# EasyEDA Pro project pcbnrf.eprj

# Schematic Schematic1
Board Name: Board1; Create Date: 2026-09-04; Page Name: P1; Project Name: projetderechercehamine; Schematic Name: Schematic1; Update Date: 2026-09-11; Company: EasyEDA.com; Page Size: A4; Version: V1.0
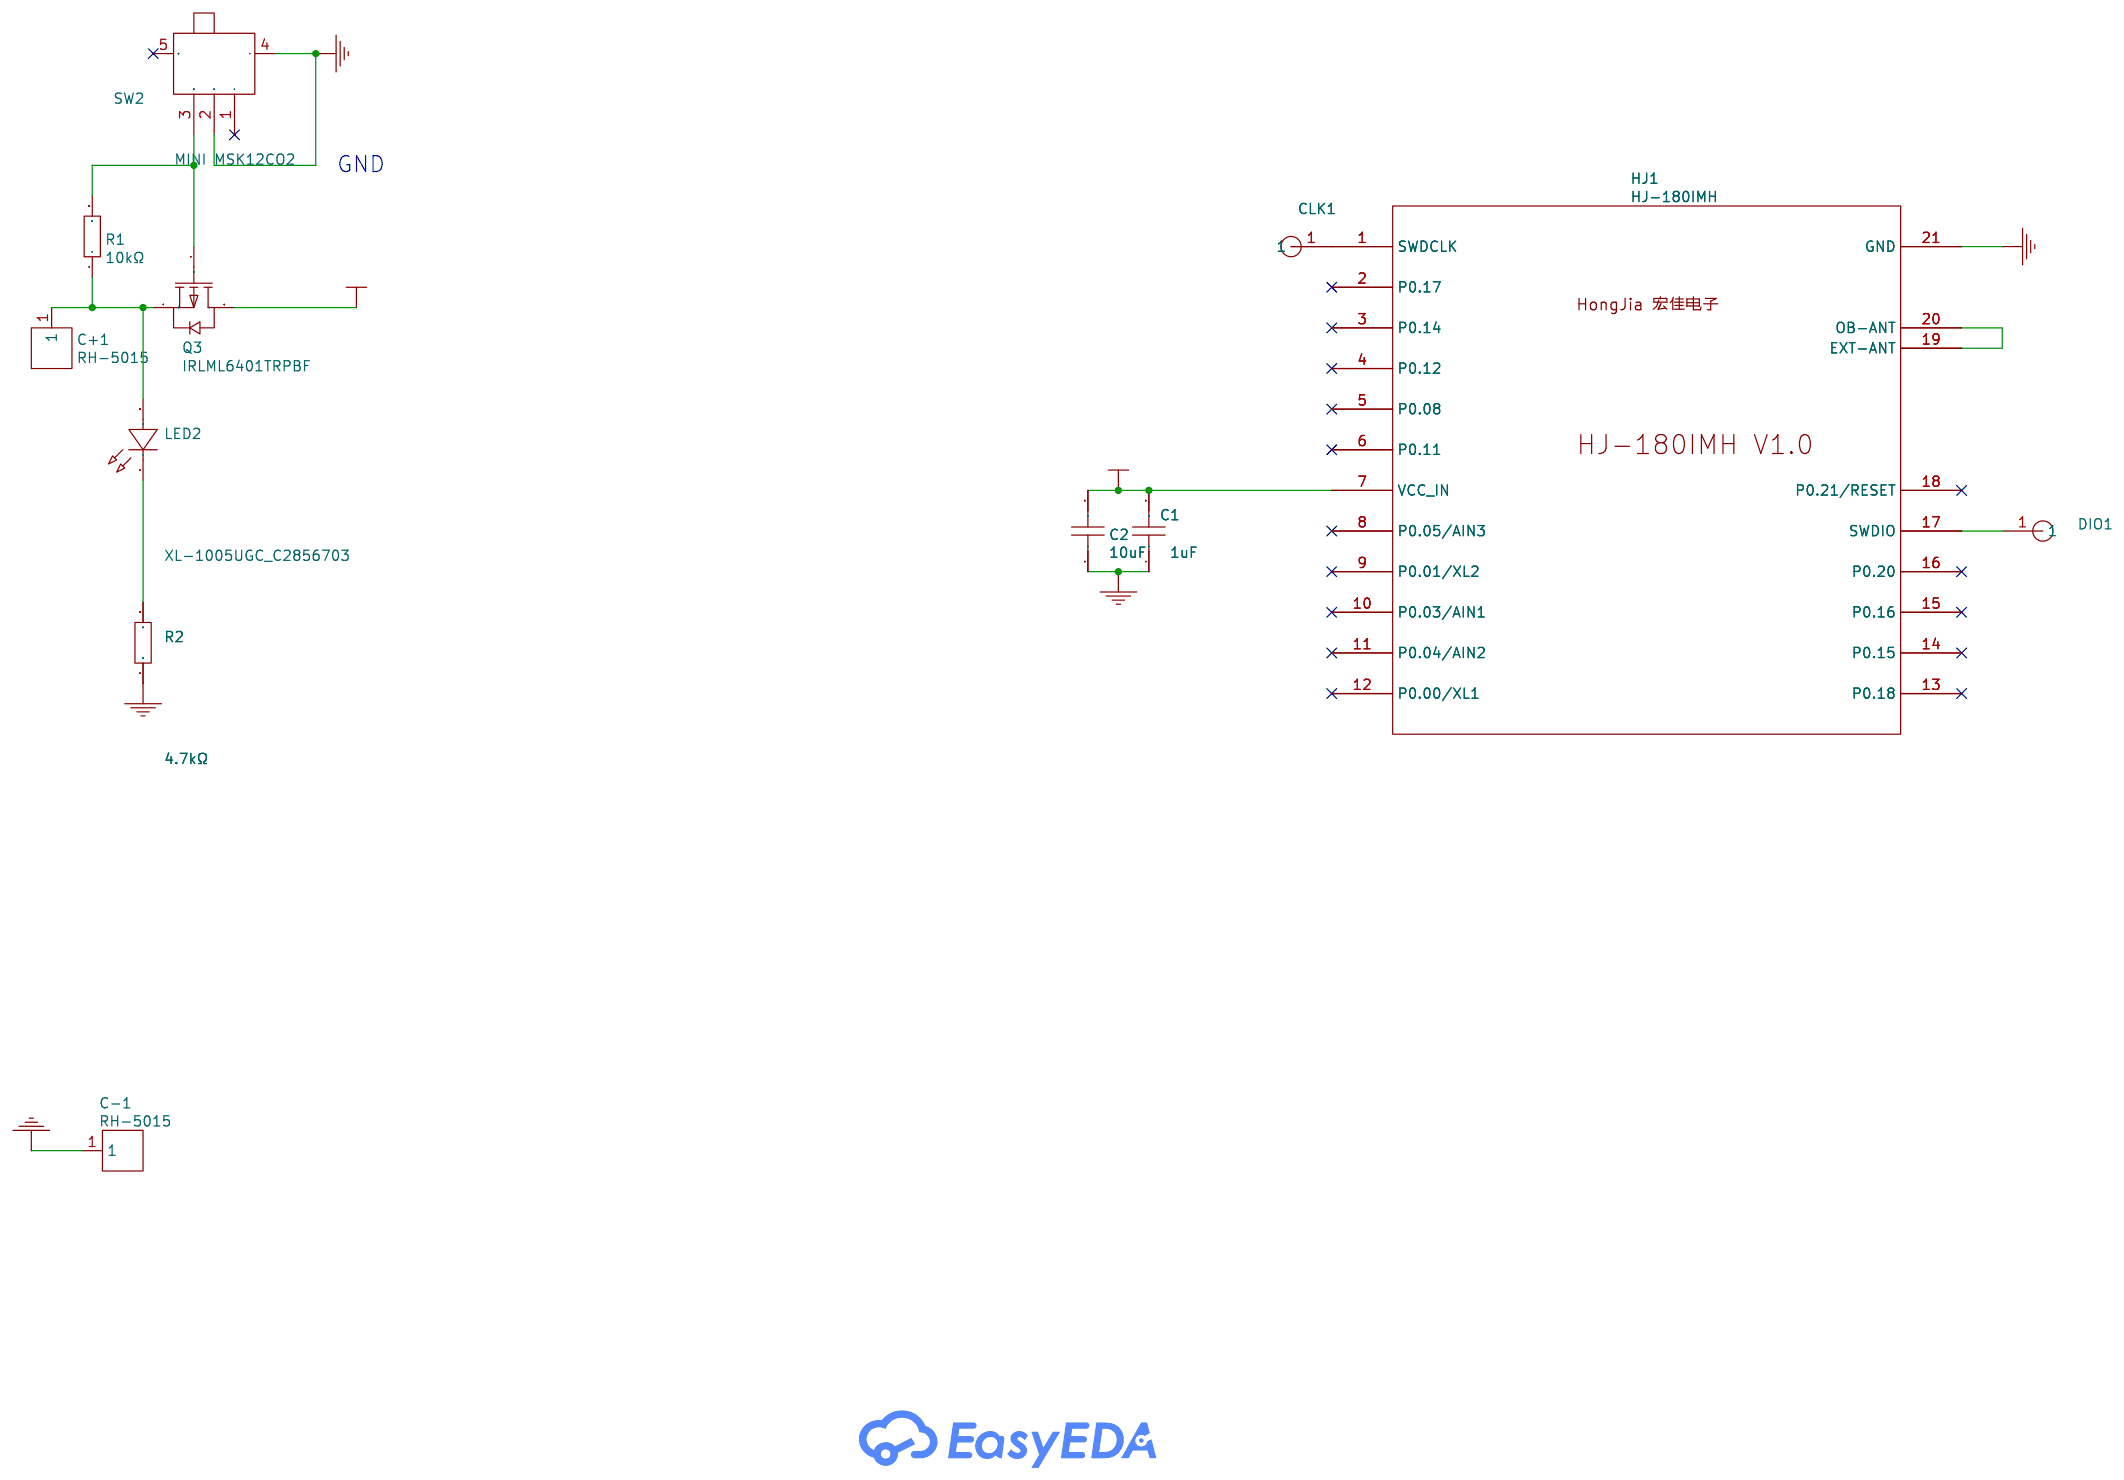
[diagram p0: schematic sheet]

## Parts
C1  1uF  [C0402]
C2  10uF  [C0402]
C+1  RH-5015  [SMD_RH-5015]
C-1  RH-5015  [SMD_RH-5015]
CLK1  TESTPOINT_D1.5mm  [TESTPOINT_D1.5MM]
DIO1  TESTPOINT_D1.5mm  [TESTPOINT_D1.5MM]
HJ1  HJ-180IMH  [HJ-180IMH(LGA21)]
LED2  XL-1005UGC_C2856703  [LED0402-RD_GREEN]
Q3  IRLML6401TRPBF  [SOT-23-3_L2.9-W1.3-P1.90-LS2.4-BR]
R1  10kΩ  [R0402]
R2  4.7kΩ  [R0402]
SW2  MINI MSK12CO2  [SW-SMD_MSK12CO2]

## Library data of the parts
C1 = CL05A105KA5NQNC: Capacitance:1uF Tolerance:±10% Tolerance:±10% Voltage Rating:25V Temperature Coefficient:X5R; LCSC Part Name: 1uF ±10% 25V; Supplier Part: C52923; Manufacturer: SAMSUNG(三星); Supplier Footprint: 0402; JLCPCB Part Class: Basic Part; Datasheet: https://item.szlcsc.com/datasheet/CL05A105KA5NQNC/53938.html; Supplier: LCSC; Tolerance: ±10%; Voltage Rating: 25V; Temperature Coefficient: X5R
C2 = CL05A106MQ5NUNC: Capacitance:10uF Tolerance:±20% Tolerance:±20% Voltage Rating:6.3V Temperature Coefficient:X5R; LCSC Part Name: 10uF ±20% 6.3V; Supplier Part: C15525; Manufacturer: SAMSUNG(三星); Supplier Footprint: 0402; JLCPCB Part Class: Basic Part; Datasheet: https://item.szlcsc.com/datasheet/CL05A106MQ5NUNC/16204.html; Supplier: LCSC; Tolerance: ±20%; Voltage Rating: 6.3V; Temperature Coefficient: X5R
C+1 C-1 = RH-5015: link: https://so.szlcsc.com/global.html?k=C5199798&amp;ref=editor; Supplier: LCSC; Supplier Part: C5199798; Manufacturer: 荣和; JLCPCB Part Class: Extended Part
CLK1 DIO1 = TESTPOINT_D1.5mm
HJ1 = HJ-180IMH
LED2 = XL-1005UGC_C2856703: link: https://so.szlcsc.com/global.html?k=C2856703&amp;ref=editor; 3DModel: LED0402_L1.0-W0.5-H0.2; Supplier: LCSC; Supplier Part: C2856703; Manufacturer: XINGLIGHT(成兴光); Manufacturer Part: XL-1005UGC; JLCPCB Part Class: Extended Part
Q3 = IRLML6401TRPBF: link: https://so.szlcsc.com/global.html?k=C3034&amp;ref=editor; 3DModel: SOT-23-3P_L2.9-W1.3-H1.0-LS2.4-P0.95; Supplier: LCSC; Manufacturer: Infineon(英飞凌); Supplier Part: C3034; JLCPCB Part Class: Extended Part
R1 = CR0402JF0103G: Type:Thick Film Resistor Resistance:10kΩ Tolerance:±5% Tolerance:±5% Power(Watts):62.5mW Voltage-Supply(Max):50V Temperature Coefficient:±200ppm/℃ Temperature Coefficient:±200ppm/℃ Operating Temperature:-55℃~+125℃ Operating Temperature:-55℃~+125℃; LCSC Part Name: 厚膜电阻 10kΩ ±5% 62.5mW; Supplier Part: C100572; Manufacturer: LIZ(丽智电子); Supplier Footprint: 0402; JLCPCB Part Class: Extended Part; Datasheet: https://item.szlcsc.com/datasheet/CR0402JF0103G/101787.html; Supplier: LCSC; Type: Thick Film Resistor; Tolerance: ±5%; Power(Watts): 62.5mW; Voltage-Supply(Max): 50V; Temperature Coefficient: ±200ppm/℃; Operating Temperature: -55℃~+125℃
R2 = ACR0402J4K7: Type:Thick Film Resistor Resistance:4.7kΩ Tolerance:±5% Tolerance:±5% Power(Watts):62.5mW Voltage-Supply(Max):50V Temperature Coefficient:±200ppm/℃ Temperature Coefficient:±200ppm/℃ Operating Temperature:-55℃~+155℃ Operating Temperature:-55℃~+155℃; LCSC Part Name: 厚膜电阻 4.7kΩ ±5% 62.5mW; Supplier Part: C5913221; Manufacturer: VO(翔胜); Supplier Footprint: 0402; JLCPCB Part Class: Extended Part; Datasheet: https://item.szlcsc.com/datasheet/ACR0402J4K7/6849733.html; Supplier: LCSC; Type: Thick Film Resistor; Tolerance: ±5%; Power(Watts): 62.5mW; Voltage-Supply(Max): 50V; Temperature Coefficient: ±200ppm/℃; Operating Temperature: -55℃~+155℃
SW2 = MINI MSK12CO2: link: https://so.szlcsc.com/global.html?k=C2681570&amp;ref=editor; Supplier: LCSC; Supplier Part: C2681570; Manufacturer: SHOU HAN(首韩); JLCPCB Part Class: Extended Part

## Nets
+3.3V: C1.2 C2.2 HJ1.7(VCC_IN) Q3.3(D)
GND: C1.1 C2.1 C-1.1 HJ1.21(GND) R2.1 SW2.2 SW2.4
$1N605: Q3.1(G) R1.2 SW2.3
$1N931: HJ1.19(EXT-ANT) HJ1.20(OB-ANT)
$1N941: DIO1.1 HJ1.17(SWDIO)
$1N942: CLK1.1 HJ1.1(SWDCLK)
$1N1928: C+1.1 LED2.2(A) Q3.2(S) R1.1
$1N1997: LED2.1(K) R2.2

Not connected (* = marked no-connect by the designer): HJ1 2(P0.17)* 3(P0.14)* 4(P0.12)* 5(P0.08)* 6(P0.11)* 8(P0.05/AIN3)* 9(P0.01/XL2)* 10(P0.03/AIN1)* 11(P0.04/AIN2)* 12(P0.00/XL1)* 13(P0.18)* 14(P0.15)* 15(P0.16)* 16(P0.20)* 18(P0.21/RESET)*; SW2 1* 5*

## Notes on the sheet
- GND

# Board PCB1
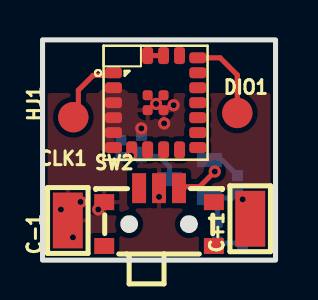
[diagram p1: board, top side]
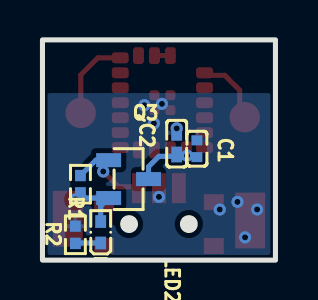
[diagram p2: board, bottom side, seen from below]

Outline 11.68 x 11.05 mm; copper layers: Top Layer, Bottom Layer. Coordinates in mm from the lower left corner of the outline.
Outline path: rectangle 0,11.05 11.68,0
Stack: Top Layer 0.035mm / Dielectric1 1.51mm FR4 er 4.5 / Bottom Layer 0.035mm

## Design rules (mm)
template: JLCPCB Capability(Two Layers Board)
spacing copperThickness1oz (default): track to track 0.102, other pairs 0.152 to 0.3
spacing copperThickness2oz: track to track 0.203, other pairs 0.152 to 0.3
track width copperThickness1oz (default): min 0.127, default 0.254, max 2.54
track width copperThickness2oz: min 0.203, default 0.254, max 2.54
differential pair differentialPair (default): width min 0.127, default 0.254, max 2.54; gap min 0.152, default 0.152
via viaSize (default): diameter min 0.5, default 0.61, max 10; hole min 0.3, default 0.305, max 6.3

## Placement (name value [footprint] x y rotation side)
C1  1uF  [C0402#2]  3.94 5.59 270 bottom
C2  10uF  [C0402]  4.95 5.84 270 bottom
C+1  RH-5015  [SMD_RH-5015]  10.41 2.08 90 top
C-1  RH-5015  [SMD_RH-5015]  1.27 1.99 90 top
CLK1  TESTPOINT_D1.5mm  [TESTPOINT_D1.5MM]  1.54 7.17 0 top
DIO1  TESTPOINT_D1.5mm  [TESTPOINT_D1.5MM]  9.77 7.38 0 top
HJ1  HJ-180IMH  [HJ-180IMH(LGA21)]  3.56 9.4 90 top
LED2  XL-1005UGC_C2856703  [LED0402-RD_GREEN]  8.76 1.4 90 bottom
Q3  IRLML6401TRPBF  [SOT-23-3_L2.9-W1.3-P1.90-LS2.4-BR]  7.37 4.06 0 bottom
R1  10kΩ  [R0402]  9.78 3.81 90 bottom
R2  4.7kΩ  [R0402]  10.03 1.27 270 bottom
SW2  MINI MSK12CO2  [SW-SMD_MSK12CO2]  5.84 2.16 0 top

## Footprints (pads in the part's own frame, mm; a bottom-side part is the same pattern mirrored in y, then rotated)
C0402
  rect 0.79x0.54 smd: 1(-0.545,0) 2(0.545,0)
C0402#2
  rect 0.5x0.54 smd: 1(-0.42,0) 2(0.42,0)
HJ-180IMH(LGA21)
  custom 0.55x0.85 smd: 1(0,0) 2(-0.75,0) 3(-1.501,0) 4(-2.251,0) 5(-3.002,0) 6(-3.752,0) 11(-3.751,-4.227) 12(-3.001,-4.227) 13(-2.251,-4.227) 14(-1.5,-4.227) 15(-0.75,-4.227) 16(0.001,-4.227) 17(0.751,-4.227)
  custom 0.85x0.55 smd: 7(-3.865,-0.914) 8(-3.865,-1.714) 9(-3.865,-2.514) 10(-3.865,-3.315) 18(0.862,-3.313) 19(0.862,-2.513) 20(0.862,-1.713)
  custom 0.5x0.5 smd: 21(-1.876,-1.713) 21(-1.875,-2.513) 21(-1.126,-1.713) 21(-1.126,-2.513)
LED0402-RD_GREEN
  rect 0.636x0.54 smd: 1(-0.538,0) 2(0.538,0)
R0402
  rect 0.566x0.54 smd: 1(-0.433,0) 2(0.433,0)
SMD_RH-5015
  rect 2.8x1.5 smd: 1(0,0)
SOT-23-3_L2.9-W1.3-P1.90-LS2.4-BR
  rect 1.25x0.7 smd: 1(1,-0.95) 2(1,0.95) 3(-1,0)
SW-SMD_MSK12CO2
  rect 0.7x1.5 smd: 1(-1,1.45) 2(0,1.45) 3(1,1.45)
  rect 1x0.8 smd: 4(-2.75,0.75) 5(2.75,0.75) 6(-2.75,-1.45) 7(2.75,-1.45)
TESTPOINT_D1.5MM
  round 1.524 smd: 1(0,0)

## Nets
As in the schematic.

Pads without a net: HJ1 2 3 4 5 6 8 9 10 11 12 13 14 15 16 18; SW2 1 5 6 7

## Via types
v1: diameter 0.61, hole 0.305, Top Layer to Bottom Layer, 12 vias

## Routing (per net, layer and track width the routed paths; a pad name or vN(x,y) marks a point on that pad's centre or on a via; arc(x,y) is an arc through that point)
+3.3V: length 3.4
  Bottom Layer w0.254: C1.2 4.82,5.17 C2.2 5.04,5.21 5.84,5.21 6.37,4.68 Q3.3
  vias: v1(4.43,5.24)
GND:
  vias: v1(0.92,2.54) v1(1.52,1.14) v1(1.91,2.92) v1(2.79,2.54) v1(4.95,6.61) v1(5.69,7.84) v1(5.84,3.17) v1(6.1,6.86) v1(6.57,7.77)
$1N605: length 3.9
  Top Layer w0.254: v1(8.64,4.45) 7.87,3.68 6.92,3.68 SW2.3
  Bottom Layer w0.254: R1.2 9.01,5.01 Q3.1
$1N931: length 0.8
  Top Layer w0.254: 5.14,10.26 5.94,10.26
$1N941: length 4.4
  Top Layer w0.254: 7.66,10.15 8.9,10.15 9.77,9.29 DIO1.1
$1N942: length 3.5
  Top Layer w0.254: 1.79,7.17 1.79,8.53 2.54,9.27 3.43,9.27 HJ1.1
$1N1928: length 2.9
  Bottom Layer w0.254: R1.1 9.52,3.11 Q3.2 8.76,2.72 LED2.2
  vias: v1(10.03,3.05)
$1N1997: length 1.3
  Bottom Layer w0.254: LED2.1 10.01,0.86 R2.2

## Copper pours and planes (outline as drawn; the poured copper is in the pictures)
GND on Top Layer: -0.38,8.38 11.68,8.38 11.68,-0.13 -0.38,-0.13
GND on Bottom Layer: -0.64,8.38 12.32,8.38 12.32,-0.13 -0.64,-0.13
